# Altium schematic sheet ATTACH.SchDoc
size A4
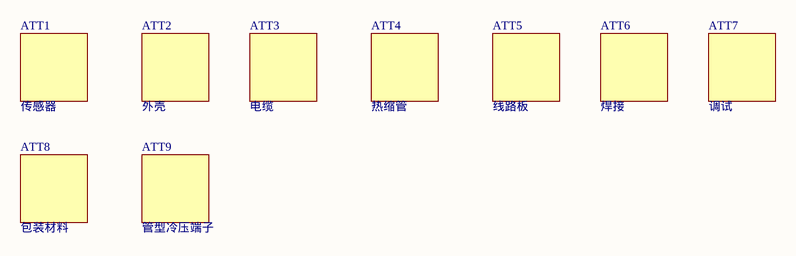
[diagram p0: ATTACH.SchDoc]

## Parts
ATT1  传感器
ATT2  外壳
ATT3  电缆
ATT4  热缩管
ATT5  线路板
ATT6  焊接
ATT7  调试
ATT8  包装材料
ATT9  管型冷压端子

## Library data of the parts
ATT1-ATT9 = ATTACHMENT